# Altium schematic sheet 03.Communicate.SchDoc: 03.Communicate
size A4; Organization: Altium Limited; Address1: L3, 12a Rodborough Rd; Address2: Frenchs Forest; Address3: NSW; Address4: Australia 2086; SheetNumber: 3; SheetTotal: 4
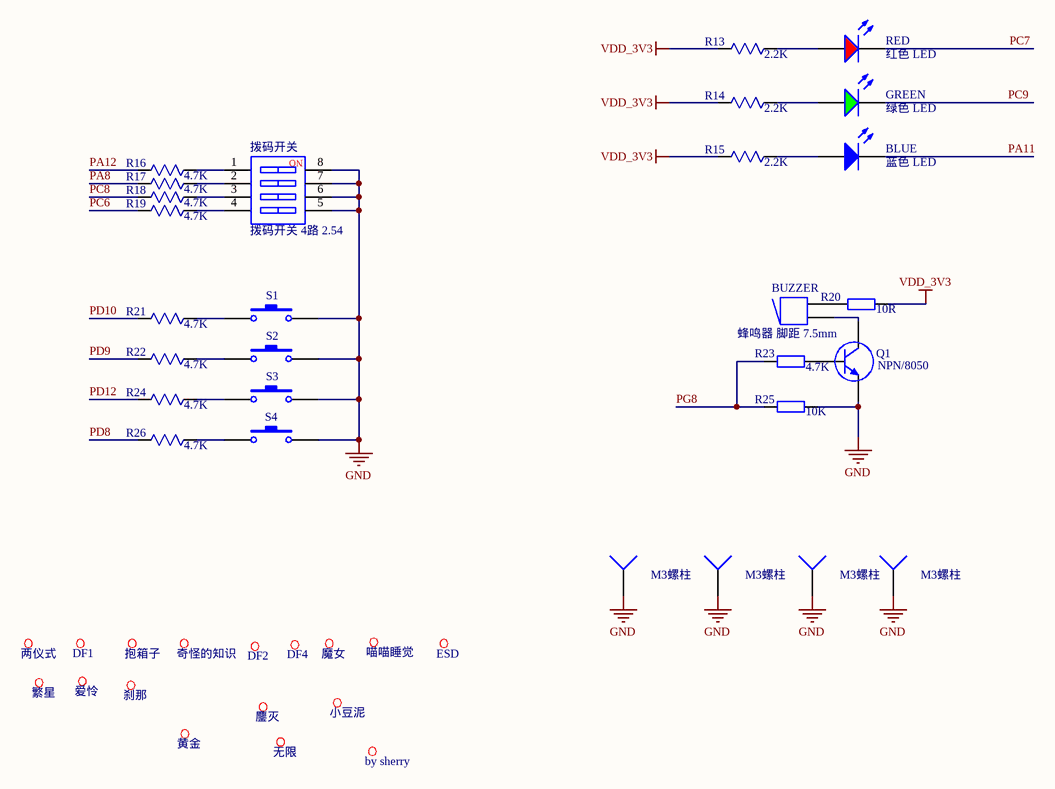
[diagram p0: 03.Communicate.SchDoc]

## Parts
(Parts that share a designator on the sheet are numbered #1, #2 ... from top to bottom, then left to right.)
?#1  两仪式  [两仪式]
?#2  DF1  [DF1]
?#3  抱箱子  [抱箱子_大]
?#4  奇怪的知识  [奇怪的知识]
?#5  DF4  [DF4小]
?#6  魔女  [魔女小]
?#7  喵喵睡觉  [喵喵睡觉]
?#8  ESD  [ESD]
?#9  DF2  [DF2]
?#10  繁星  [繁星]
?#11  爱怜  [爱怜]
?#12  刹那  [刹那]
?#13  小豆泥  [小豆泥]
?#14  鏖灭  [鏖灭]
?#15  黄金  [黄金]
?#16  无限  [无限]
?#17  by sherry  [IMPORTED_IMAGE]
BLUE  蓝色 LED  [0603 LED B]
BUZZER  蜂鸣器 脚距 7.5mm  [蜂鸣器5.5mm脚距]
GREEN  绿色 LED  [0603 LED G]
J1  M3螺柱  [MTGP720H320V6P - duplicate]
J2  M3螺柱  [MTGP720H320V6P - duplicate]
J3  M3螺柱  [MTGP720H320V6P - duplicate]
J4  M3螺柱  [MTGP720H320V6P - duplicate]
Q1  NPN/8050  [SOT232-3 三极管]
R13  2.2K  [R0603]
R14  2.2K  [R0603]
R15  2.2K  [R0603]
R16  4.7K  [R0603]
R17  4.7K  [R0603]
R18  4.7K  [R0603]
R19  4.7K  [R0603]
R20  value 10R  [0603 电阻 R3]  (hidden comment: 4.7K)
R21  4.7K  [R0603]
R22  4.7K  [R0603]
R23  4.7K  [0603 电阻 R3]
R24  4.7K  [R0603]
R25  value 10K  [0603 电阻 R3]  (hidden comment: 4.7K)
R26  4.7K  [R0603]
RED  红色 LED  [0603 LED R]
S1  SW-PB  [TSW SMD-3*6*2.5]  (value not drawn)
S2  SW-PB  [TSW SMD-3*6*2.5]  (value not drawn)
S3  SW-PB  [TSW SMD-3*6*2.5]  (value not drawn)
S4  SW-PB  [TSW SMD-3*6*2.5]  (value not drawn)
拨码开关  拨码开关 4路 2.54  [CSW DIP-2P_G]

## Nets
GND: J1.1 J2.1 J3.1 J4.1 Q1.2(E) R25.2 S1.2 S2.2 S3.2 S4.2 拨码开关.5 拨码开关.6 拨码开关.7 拨码开关.8
VDD_3V3: R13.1 R14.1 R15.1 R20.2
PA8: R17.1
PA11: BLUE.2
PA12: R16.1
PC6: R19.1
PC7: RED.2
PC8: R18.1
PC9: GREEN.2
PD8: R26.1
PD9: R22.1
PD10: R21.1
PD12: R24.1
PG8: R23.1 R25.1
NetBLUE_1: BLUE.1 R15.2
NetBUZZER_1: BUZZER.1 R20.1
NetBUZZER_2: BUZZER.2 Q1.3(C)
NetGREEN_1: GREEN.1 R14.2
NetQ1_1: Q1.1(B) R23.2
NetR13_2: R13.2 RED.1
NetR16_2: R16.2 拨码开关.1
NetR17_2: R17.2 拨码开关.2
NetR18_2: R18.2 拨码开关.3
NetR19_2: R19.2 拨码开关.4
NetR21_2: R21.2 S1.1
NetR22_2: R22.2 S2.1
NetR24_2: R24.2 S3.1
NetR26_2: R26.2 S4.1

## Notes on the sheet
- Title：
- Size:
- Project：
- A4
- Date:
- MM32F3277G9P
- Revision:
- V1.0
- Author：
- Haibara
- Sheet:
- of:
- (in symbol CSW-4P) NO

## Library data of the parts
?#8 = 东方
BLUE = 蓝灯: 发光二极管; ComponentLink1Description: 供应商链接; ComponentLink1URL: http://www.szlcsc.com/product/details_2666.html; Package: 0805; Supplier: LC; SuppliersPartNumber: C2293
BUZZER = Buzzer: Magnetic Transducer Buzzer; Published: 24-Mar-1999; LatestRevisionDate: 17-Dec-2003; LatestRevisionNote: Schematic revised, PCB Footprint replaced.; DatasheetVersion: 17-Dec-2003; PackageReference: ABSM-1574; Publisher: Altium Limited; PackageDescription: Magnetic Transducer Buzzer; ComponentLink1Description: Manufacturer Link; ComponentLink1URL: http://www.megastar.com/linecard/buzzmode/index.php
GREEN = 绿灯: 发光二极管; ComponentLink1Description: 供应商链接; ComponentLink1URL: http://www.szlcsc.com/product/details_2670.html; Package: 0805; Supplier: LC; SuppliersPartNumber: C2297
J1-J4 = Socket: LatestRevisionDate: 17-Jul-2002; LatestRevisionNote: Re-released for DXP Platform.; Publisher: Altium Limited
R13-R19 R21 R22 R24 R26 = 电阻
R20 R25 = Res2: Resistor; Published: 8-Jun-2000; LatestRevisionDate: 17-Jul-2002; LatestRevisionNote: Re-released for DXP Platform.; PackageReference: AXIAL-0.4; Publisher: Altium Limited; PackageDescription: Axial Device, Thru-Hole; 2 Leads; 0.4 in Pin Spacing
R23 = Res2: Resistor; Value: 4.7R; Published: 8-Jun-2000; LatestRevisionDate: 17-Jul-2002; LatestRevisionNote: Re-released for DXP Platform.; PackageReference: AXIAL-0.4; Publisher: Altium Limited; PackageDescription: Axial Device, Thru-Hole; 2 Leads; 0.4 in Pin Spacing
RED = 红灯: 发光二极管; ComponentLink1Description: 供应商链接; ComponentLink1URL: http://www.szlcsc.com/product/details_2668.html; Package: 0805; Supplier: LC; SuppliersPartNumber: C2295
S1-S4 = SW-PB: Switch; Published: 24-Mar-1999; LatestRevisionDate: 17-Jul-2002; LatestRevisionNote: Re-released for DXP Platform.; PackageReference: SPST-2; Publisher: Altium Limited; PackageDescription: Switch; 2 Leads
拨码开关 = CSW-4P: 4路编码开关; 版权归属: 源创客; BOM名称: 4路编码开关; 学习资源: www.ooocke.com